# Altium schematic sheet BASSTreble.SchDoc
size A4; SheetNumber: 3; SheetTotal: 5
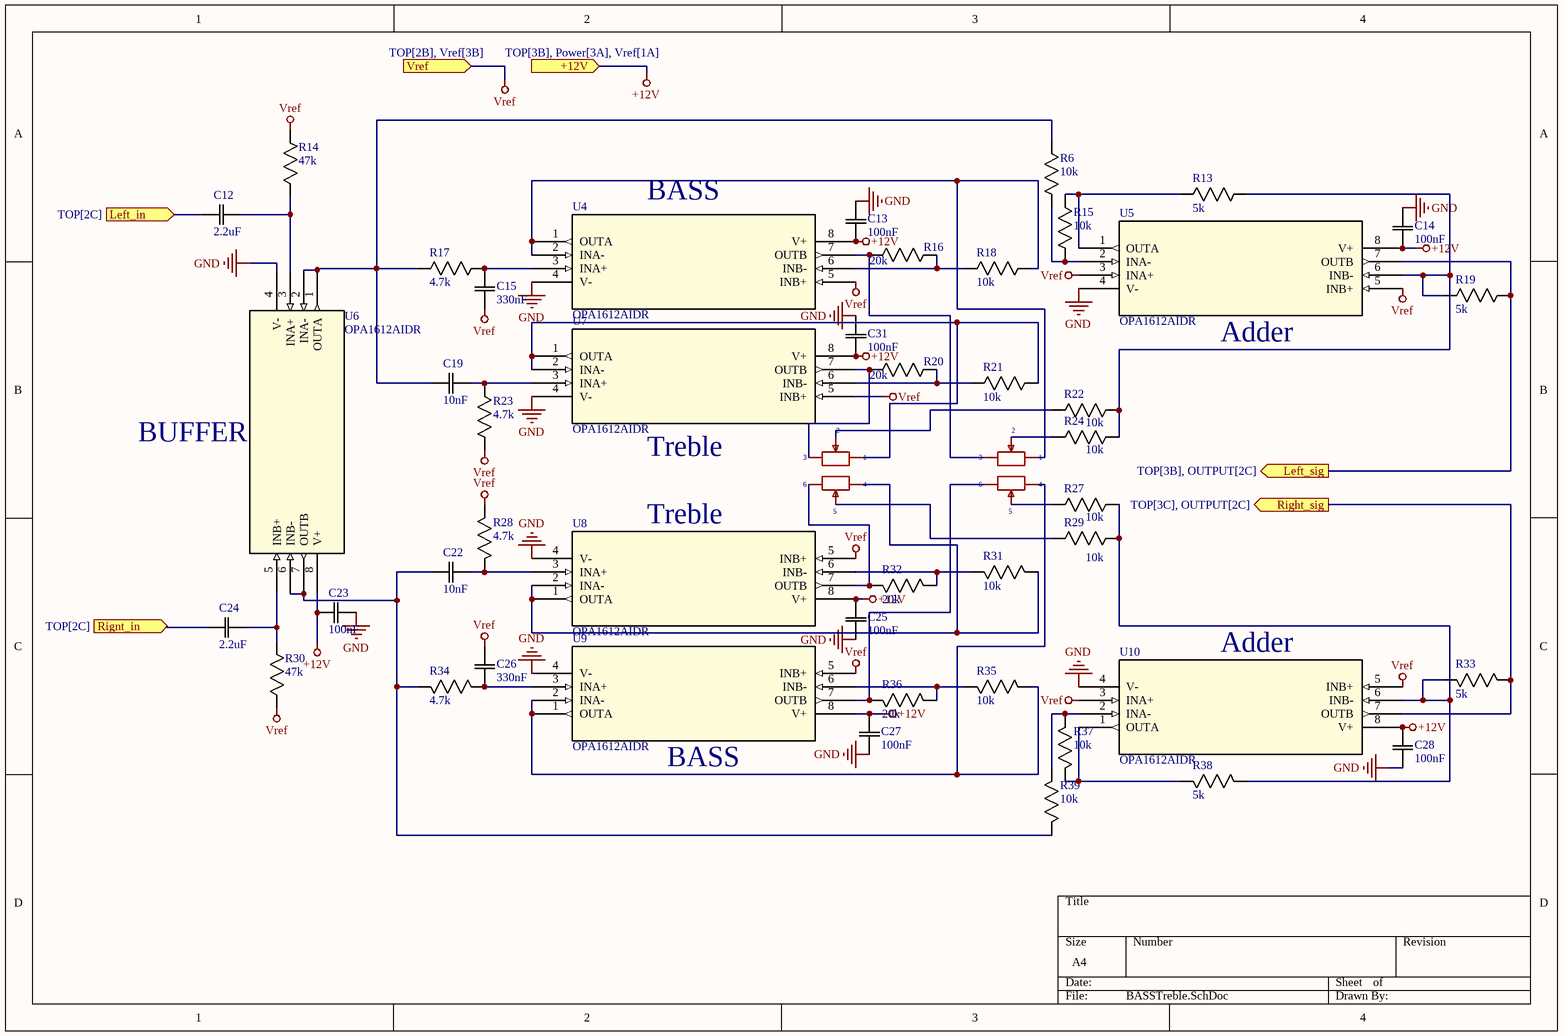
[diagram p0: BASSTreble.SchDoc]

## Parts
C12  2.2uF  [0603 Cap - C0G]
C13  100nF  [0603 Cap - C0G]
C14  100nF  [0603 Cap - C0G]
C15  330nF  [1206 CAP C0G]
C19  10nF  [0805 CAP - C0G]
C22  10nF  [0805 CAP - C0G]
C23  100nF  [0603 Cap - C0G]
C24  2.2uF  [0603 Cap - C0G]
C25  100nF  [0603 Cap - C0G]
C26  330nF  [1206 CAP C0G]
C27  100nF  [0603 Cap - C0G]
C28  100nF  [0603 Cap - C0G]
C31  100nF  [0603 Cap - C0G]
R6  10k  [0603 RES]
R13  5k  [0603 RES]
R14  47k  [0603 RES]
R15  10k  [0603 RES]
R16  20k  [0603 RES]
R17  4.7k  [0603 RES]
R18  10k  [0603 RES]
R19  5k  [0603 RES]
R20  20k  [0603 RES]
R21  10k  [0603 RES]
R22  10k  [0603 RES]
R23  4.7k  [0603 RES]
R24  10k  [0603 RES]
R25  10K  [Potentiometers 10K RK16312101A2]  (value not drawn)
R26  10K  [Potentiometers 10K RK16312101A2]  (value not drawn)
R27  10k  [0603 RES]
R28  4.7k  [0603 RES]
R29  10k  [0603 RES]
R30  47k  [0603 RES]
R31  10k  [0603 RES]
R32  20k  [0603 RES]
R33  5k  [0603 RES]
R34  4.7k  [0603 RES]
R35  10k  [0603 RES]
R36  20k  [0603 RES]
R37  10k  [0603 RES]
R38  5k  [0603 RES]
R39  10k  [0603 RES]
U4  OPA1612AIDR  [OPA1612AIDR]
U5  OPA1612AIDR  [OPA1612AIDR]
U6  OPA1612AIDR  [OPA1612AIDR]
U7  OPA1612AIDR  [OPA1612AIDR]
U8  OPA1612AIDR  [OPA1612AIDR]
U9  OPA1612AIDR  [OPA1612AIDR]
U10  OPA1612AIDR  [OPA1612AIDR]

## Ports
+12V (in, see TOP[3B], Power[3A], Vref[1A]), Left_in (in, see TOP[2C]), Left_sig (out, see TOP[3B], OUTPUT[2C]), Right_sig (out, see TOP[3C], OUTPUT[2C]), Rignt_in (in, see TOP[2C]), Vref (in, see TOP[2B], Vref[3B])

## Nets
+12V: C13.1 C14.1 C23.1 C25.2 C27.2 C28.2 C31.1 U4.8(V+) U5.8(V+) U6.8(V+) U7.8(V+) U8.8(V+) U9.8(V+) U10.8(V+) ; port +12V
GND: C13.2 C14.2 C23.2 C25.1 C27.1 C28.1 C31.2 U4.4(V-) U5.4(V-) U6.4(V-) U7.4(V-) U8.4(V-) U9.4(V-) U10.4(V-)
Vref: C15.1 C26.2 R14.1 R23.1 R28.1 R30.1 U4.5(INB+) U5.3(INA+) U5.5(INB+) U7.5(INB+) U8.5(INB+) U9.5(INB+) U10.3(INA+) U10.5(INB+) ; port Vref
Left_in: C12.1 ; port Left_in
Left_sig: R19.1 U5.7(OUTB) ; port Left_sig
Right_sig: R33.1 U10.7(OUTB) ; port Right_sig
Rignt_in: C24.1 ; port Rignt_in
NetC12_2: C12.2 R14.2 U6.3(INA+)
NetC15_2: C15.2 R17.2 U4.3(INA+)
NetC19_1: C19.1 R6.2 R17.1 U6.1(OUTA) U6.2(INA-)
NetC19_2: C19.2 R23.2 U7.3(INA+)
NetC22_1: C22.1 R34.1 R39.2 U6.6(INB-) U6.7(OUTB)
NetC22_2: C22.2 R28.2 U8.3(INA+)
NetC24_2: C24.2 R30.2 U6.5(INB+)
NetC26_1: C26.1 R34.2 U9.3(INA+)
NetR6_1: R6.1 R15.1 U5.2(INA-)
NetR13_1: R13.1 R19.2 R22.2 R24.2 U5.6(INB-)
NetR13_2: R13.2 R15.2 U5.1(OUTA)
NetR16_1: R16.1 R25.3 U4.7(OUTB)
NetR16_2: R16.2 R18.1 U4.6(INB-)
NetR18_2: R18.2 R25.1 U4.1(OUTA) U4.2(INA-)
NetR20_1: R20.1 R26.3 U7.7(OUTB)
NetR20_2: R20.2 R21.1 U7.6(INB-)
NetR21_2: R21.2 R26.1 U7.1(OUTA) U7.2(INA-)
NetR22_1: R22.1 R26.2
NetR24_1: R24.1 R25.2
NetR25_4: R25.4 R35.2 U9.1(OUTA) U9.2(INA-)
NetR25_5: R25.5 R27.1
NetR25_6: R25.6 R36.1 U9.7(OUTB)
NetR26_4: R26.4 R31.2 U8.1(OUTA) U8.2(INA-)
NetR26_5: R26.5 R29.1
NetR26_6: R26.6 R32.1 U8.7(OUTB)
NetR27_2: R27.2 R29.2 R33.2 R38.1 U10.6(INB-)
NetR31_1: R31.1 R32.2 U8.6(INB-)
NetR35_1: R35.1 R36.2 U9.6(INB-)
NetR37_1: R37.1 R39.1 U10.2(INA-)
NetR37_2: R37.2 R38.2 U10.1(OUTA)

## Notes on the sheet
- (near U4) BASS
- (near U5) Adder
- (near U6) BUFFER
- (near U7) Treble
- (near U8) Treble
- (near U10) Adder
- (near U9) BASS

## Library data of the parts
C12-C15 C19 C22-C28 C31 = CAP_CERAMIC: Manufacturer_Name: Kemet; Manufacturer_Part_Number: C0603C104K5RACTU; Copyright: Copyright (C) 2026 Ultra Librarian. All rights reserved.
R6 R13-R24 R27-R39 = Resistor: Manufacturer_Name: Vishay; Manufacturer_Part_Number: CRCW060310K0FKEA; Copyright: Copyright (C) 2025 Ultra Librarian. All rights reserved.
R25 R26 = Potentiometers 10K RK16312101A2: Resistance: 10K Tolerance:±20% Tolerance:±20% Rated Voltage:- Power(Watts):- Turns:; Manufacturer: ALPSALPINE(阿尔卑斯阿尔派); AddInBom: yes; ModelId: 92b7132f4c3c4015aff86e677bf882d2; ModelName: RES-ADJ-TH_RK16312A0BKR; ModelTransform: 1066.927,708.66,0,0,0,0,326.772,0,-137.795; Value: 10kΩ; Tolerance: ±20%; Symbol: RK16312101A2; LCSC Part Name: 10kΩ ±20% 三件套; SupplierPart: C470593; ManufacturerPart: RK16312101A2; Supplier Footprint: 插件-6P; JLCPCB Part Class: Extended Part; Datasheet: https://atta.szlcsc.com/upload/public/pdf/source/20191216/C470593_7E935C2EB9A734DEAF0A292D32EDD773.pdf; Supplier: LCSC; ConvertToPcb: yes; FootprintName: RES-ADJ-TH_RK16312A0BKR; Rated Voltage: -; Power(Watts): -
U4-U10 = OPA1612AIDR: SoundPlusâ„¢ Audio Operational Amplifier with 1.1nV/âˆšHz Noise, Low THD and Precision 8-SOIC -40 to 85; Manufacturer_Name: Texas Instruments; Copyright: Copyright (C) 2025 Ultra Librarian. All rights reserved.; Manufacturer_Part_Number: OPA1612AIDR; RefDes: RefDes; Type: Type